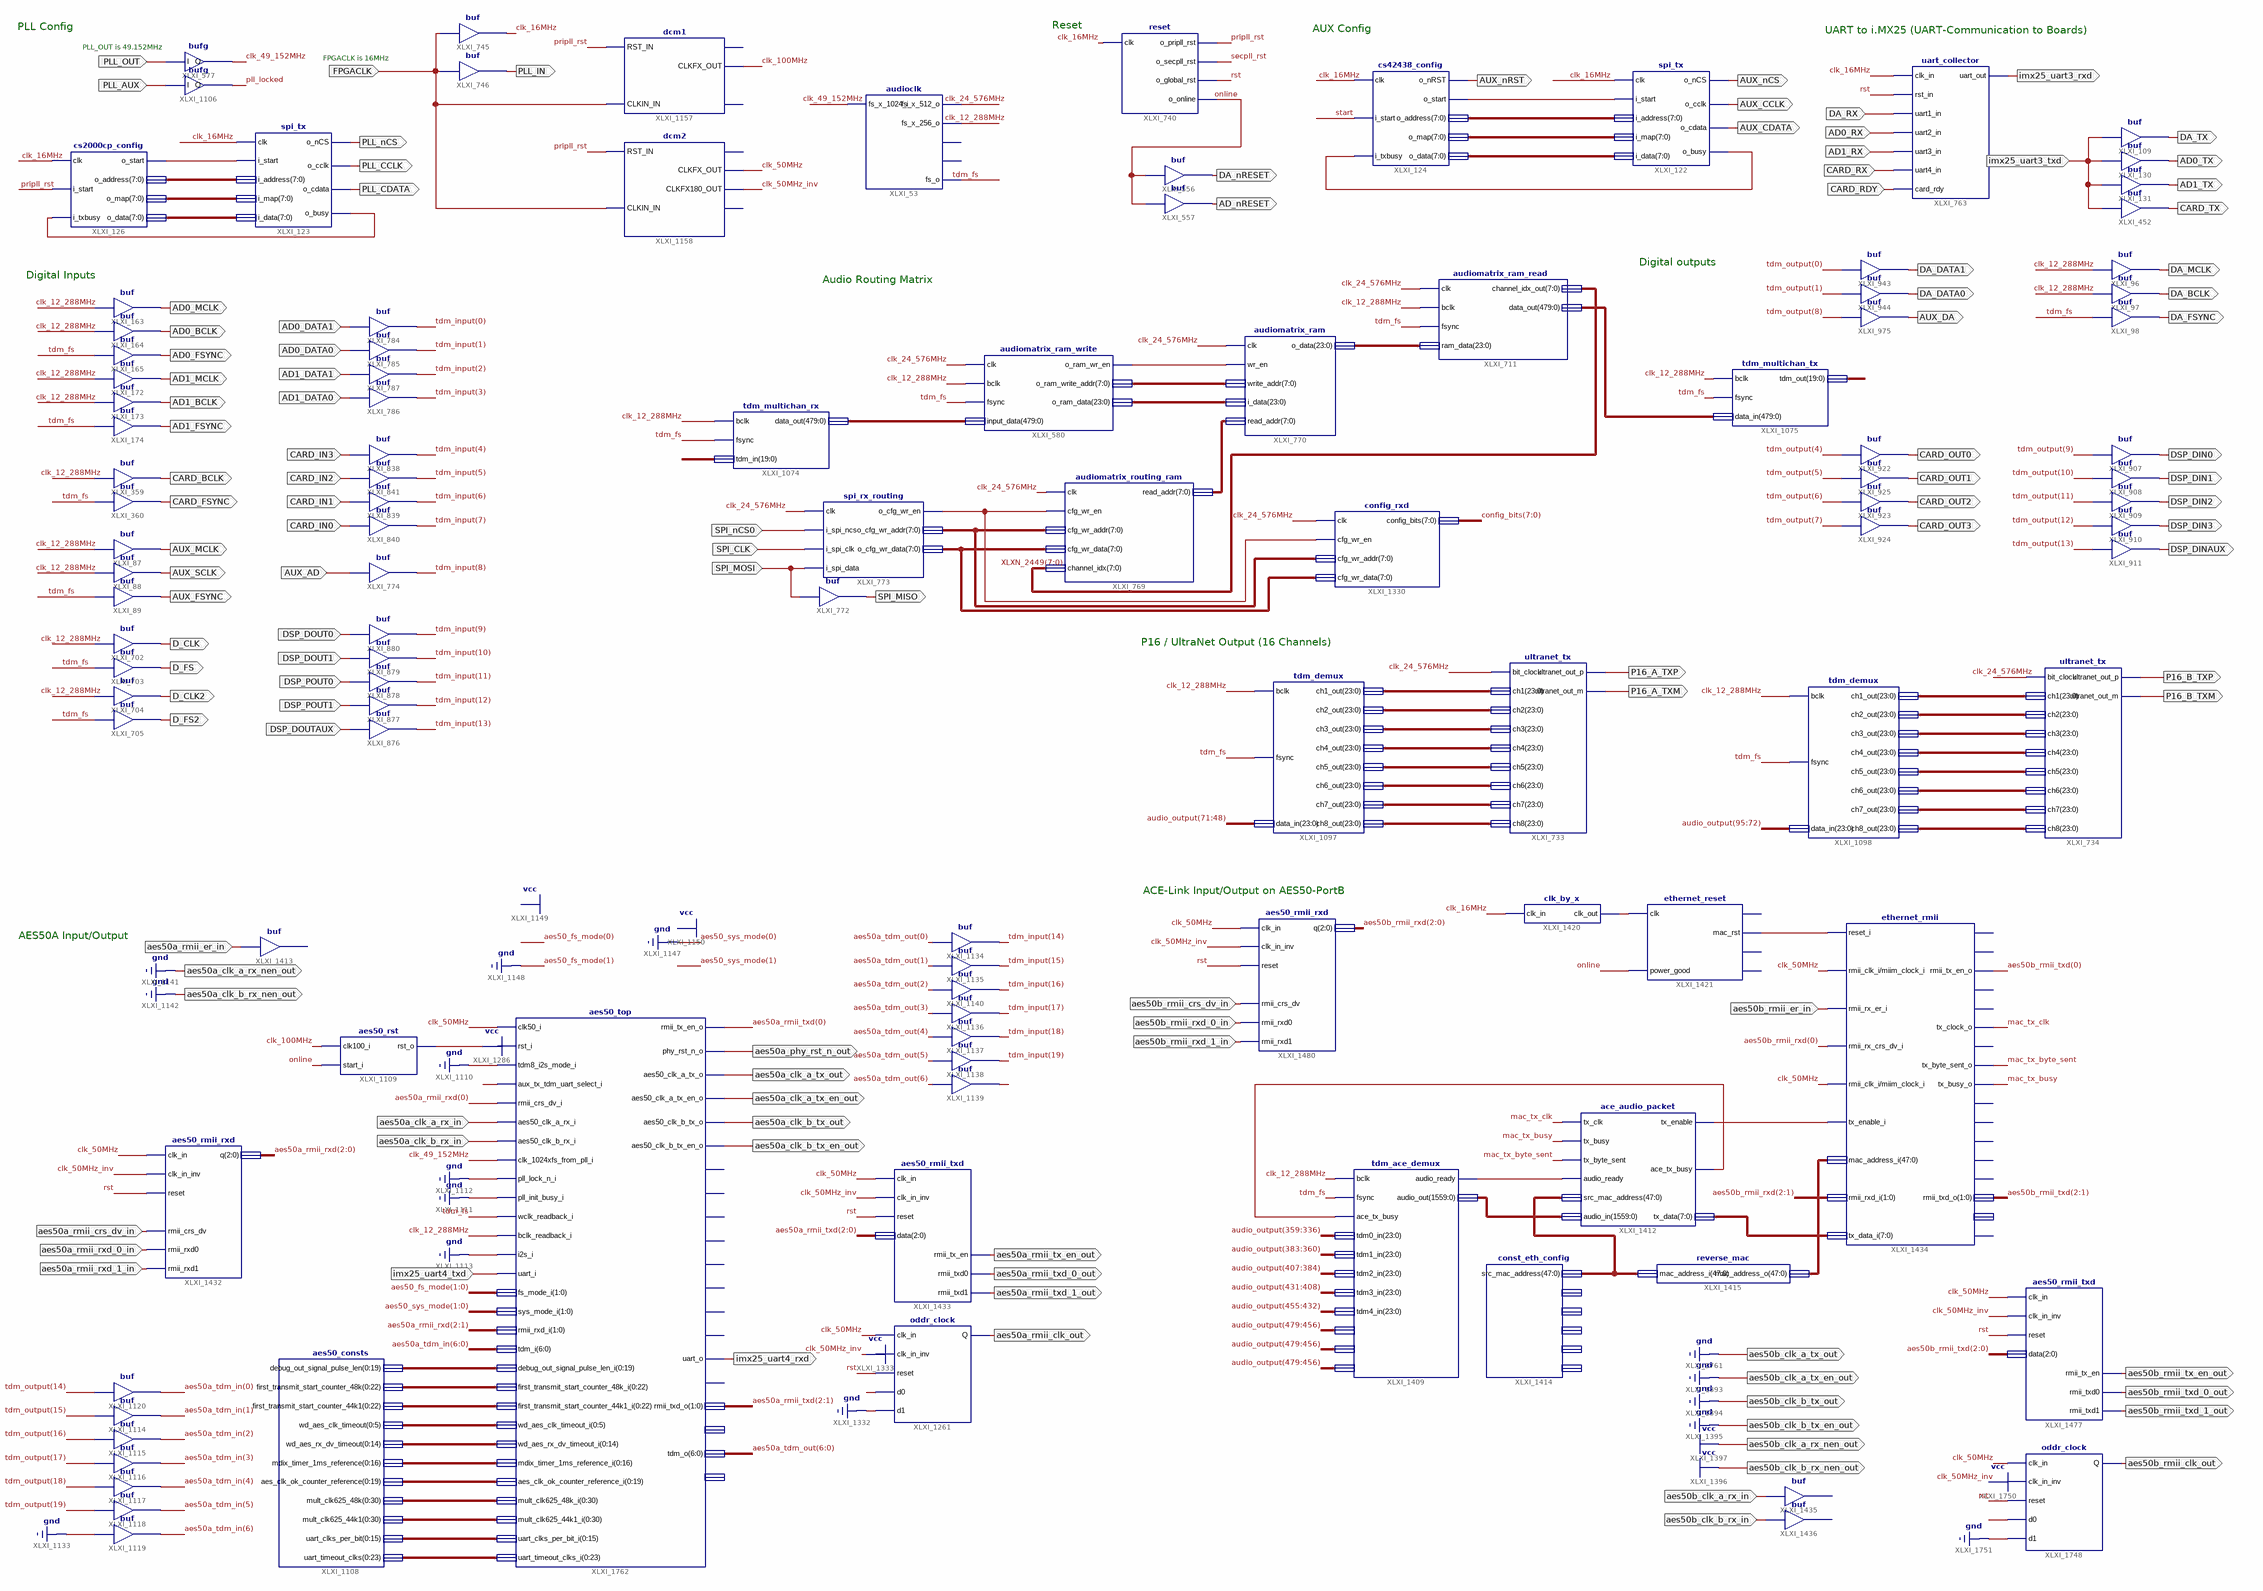
[diagram p0: schematic sheet 1]
// Xilinx ISE schematic main_aes50_and_ace.sch (spartan3a) as structural Verilog: 109 symbols, 111 ports
module main_aes50_and_ace (
  input  FPGACLK,
  input  PLL_OUT,
  input  PLL_AUX,
  input  aes50a_clk_a_rx_in,
  input  aes50a_clk_b_rx_in,
  input  imx25_uart4_txd,
  input  aes50a_rmii_er_in,
  input  aes50a_rmii_crs_dv_in,
  input  aes50a_rmii_rxd_0_in,
  input  aes50a_rmii_rxd_1_in,
  input  SPI_MOSI,
  input  SPI_CLK,
  input  SPI_nCS0,
  input  imx25_uart3_txd,
  input  CARD_RX,
  input  AD1_RX,
  input  AD0_RX,
  input  DA_RX,
  input  CARD_RDY,
  input  AD0_DATA1,
  input  AD0_DATA0,
  input  AD1_DATA1,
  input  AD1_DATA0,
  input  CARD_IN3,
  input  CARD_IN2,
  input  CARD_IN1,
  input  CARD_IN0,
  input  AUX_AD,
  input  DSP_DOUT0,
  input  DSP_DOUT1,
  input  DSP_POUT0,
  input  DSP_POUT1,
  input  DSP_DOUTAUX,
  input  aes50b_rmii_er_in,
  input  aes50b_rmii_crs_dv_in,
  input  aes50b_rmii_rxd_0_in,
  input  aes50b_rmii_rxd_1_in,
  input  aes50b_clk_a_rx_in,
  input  aes50b_clk_b_rx_in,
  output PLL_nCS,
  output PLL_CDATA,
  output PLL_CCLK,
  output PLL_IN,
  output aes50a_clk_b_rx_nen_out,
  output aes50a_clk_a_rx_nen_out,
  output aes50a_rmii_tx_en_out,
  output aes50a_rmii_txd_0_out,
  output aes50a_rmii_txd_1_out,
  output aes50a_rmii_clk_out,
  output SPI_MISO,
  output DSP_DIN0,
  output DSP_DIN1,
  output DSP_DIN2,
  output DSP_DIN3,
  output DSP_DINAUX,
  output CARD_OUT0,
  output CARD_OUT1,
  output CARD_OUT2,
  output CARD_OUT3,
  output DA_MCLK,
  output DA_BCLK,
  output DA_FSYNC,
  output DA_DATA0,
  output DA_DATA1,
  output AUX_DA,
  output P16_A_TXP,
  output P16_A_TXM,
  output P16_B_TXP,
  output P16_B_TXM,
  output DA_TX,
  output AD0_TX,
  output AD1_TX,
  output CARD_TX,
  output imx25_uart3_rxd,
  output AUX_nRST,
  output AUX_nCS,
  output AUX_CCLK,
  output AUX_CDATA,
  output AD_nRESET,
  output DA_nRESET,
  output AD1_MCLK,
  output AD1_BCLK,
  output AD1_FSYNC,
  output AD0_MCLK,
  output AD0_BCLK,
  output AD0_FSYNC,
  output CARD_BCLK,
  output CARD_FSYNC,
  output AUX_MCLK,
  output AUX_SCLK,
  output AUX_FSYNC,
  output D_CLK2,
  output D_FS2,
  output D_CLK,
  output D_FS,
  output aes50b_rmii_clk_out,
  output aes50b_rmii_tx_en_out,
  output aes50b_rmii_txd_0_out,
  output aes50b_rmii_txd_1_out,
  output aes50b_clk_b_rx_nen_out,
  output aes50b_clk_a_rx_nen_out,
  output aes50b_clk_b_tx_en_out,
  output aes50b_clk_b_tx_out,
  output aes50b_clk_a_tx_en_out,
  output aes50b_clk_a_tx_out,
  output imx25_uart4_rxd,
  output aes50a_phy_rst_n_out,
  output aes50a_clk_a_tx_out,
  output aes50a_clk_a_tx_en_out,
  output aes50a_clk_b_tx_out,
  output aes50a_clk_b_tx_en_out
);

  wire clk_12_288MHz, clk_16MHz, clk_24_576MHz, clk_49_152MHz, clk_50MHz, clk_50MHz_inv, clk_100MHz,
       mac_tx_busy, mac_tx_byte_sent, mac_tx_clk, online, pll_locked, pripll_rst, rst, secpll_rst, start,
       tdm_fs, XLXN_70, XLXN_222, XLXN_226, XLXN_346, XLXN_1898, XLXN_2460, XLXN_3074, XLXN_3123, XLXN_3858,
       XLXN_3874, XLXN_3892, XLXN_3930, XLXN_3936;
  wire [2:0] aes50a_rmii_rxd, aes50a_rmii_txd, aes50b_rmii_rxd, aes50b_rmii_txd;
  wire [5:0] XLXN_4220;
  wire [6:0] aes50a_tdm_in, aes50a_tdm_out;
  wire [7:0] config_bits, XLXN_67, XLXN_68, XLXN_69, XLXN_223, XLXN_224, XLXN_225, XLXN_2448, XLXN_2449,
       XLXN_2997, XLXN_3661, XLXN_3662, XLXN_4092;
  wire [14:0] XLXN_4221;
  wire [15:0] XLXN_4226;
  wire [16:0] XLXN_4222;
  wire [19:0] tdm_input, tdm_output, XLXN_4217, XLXN_4223;
  wire [22:0] XLXN_4218, XLXN_4219;
  wire [23:0] XLXN_2996, XLXN_2998, XLXN_3049, XLXN_3050, XLXN_3051, XLXN_3052, XLXN_3053, XLXN_3054,
       XLXN_3055, XLXN_3056, XLXN_3057, XLXN_3058, XLXN_3059, XLXN_3060, XLXN_3061, XLXN_3062, XLXN_3063,
       XLXN_3064, XLXN_4227;
  wire [30:0] XLXN_4224, XLXN_4225;
  wire [47:0] XLXN_3937, XLXN_3939;
  wire [479:0] audio_output, XLXN_2995;
  wire [1559:0] XLXN_3863;

  cs2000cp_config XLXI_126 (
    .clk(clk_16MHz), .i_start(pripll_rst), .i_txbusy(XLXN_226), .o_start(XLXN_222), .o_address(XLXN_223),
    .o_map(XLXN_224), .o_data(XLXN_225));
  spi_tx XLXI_123 (
    .clk(clk_16MHz), .i_start(XLXN_222), .i_address(XLXN_223), .i_map(XLXN_224), .i_data(XLXN_225),
    .o_nCS(PLL_nCS), .o_cclk(PLL_CCLK), .o_cdata(PLL_CDATA), .o_busy(XLXN_226));
  bufg XLXI_577 (.I(PLL_OUT), .O(clk_49_152MHz));
  bufg XLXI_1106 (.I(PLL_AUX), .O(pll_locked));
  buf XLXI_745 (clk_16MHz, FPGACLK);
  buf XLXI_746 (PLL_IN, FPGACLK);
  dcm1 XLXI_1157 (.CLKIN_IN(FPGACLK), .RST_IN(pripll_rst), .CLKFX_OUT(clk_100MHz));  // open: LOCKED_OUT, CLK0_OUT
  dcm2 XLXI_1158 (
    .CLKIN_IN(FPGACLK), .RST_IN(pripll_rst), .CLKFX_OUT(clk_50MHz), .CLKFX180_OUT(clk_50MHz_inv));  // open: LOCKED_OUT, CLK0_OUT
  aes50_rst XLXI_1109 (.clk100_i(clk_100MHz), .start_i(online), .rst_o(XLXN_3074));
  aes50_consts XLXI_1108 (
    .debug_out_signal_pulse_len({XLXN_4217[0], XLXN_4217[1], XLXN_4217[2], XLXN_4217[3], XLXN_4217[4], XLXN_4217[5], XLXN_4217[6], XLXN_4217[7], XLXN_4217[8], XLXN_4217[9], XLXN_4217[10], XLXN_4217[11], XLXN_4217[12], XLXN_4217[13], XLXN_4217[14], XLXN_4217[15], XLXN_4217[16], XLXN_4217[17], XLXN_4217[18], XLXN_4217[19]}),
    .first_transmit_start_counter_48k({XLXN_4218[0], XLXN_4218[1], XLXN_4218[2], XLXN_4218[3], XLXN_4218[4], XLXN_4218[5], XLXN_4218[6], XLXN_4218[7], XLXN_4218[8], XLXN_4218[9], XLXN_4218[10], XLXN_4218[11], XLXN_4218[12], XLXN_4218[13], XLXN_4218[14], XLXN_4218[15], XLXN_4218[16], XLXN_4218[17], XLXN_4218[18], XLXN_4218[19], XLXN_4218[20], XLXN_4218[21], XLXN_4218[22]}),
    .first_transmit_start_counter_44k1({XLXN_4219[0], XLXN_4219[1], XLXN_4219[2], XLXN_4219[3], XLXN_4219[4], XLXN_4219[5], XLXN_4219[6], XLXN_4219[7], XLXN_4219[8], XLXN_4219[9], XLXN_4219[10], XLXN_4219[11], XLXN_4219[12], XLXN_4219[13], XLXN_4219[14], XLXN_4219[15], XLXN_4219[16], XLXN_4219[17], XLXN_4219[18], XLXN_4219[19], XLXN_4219[20], XLXN_4219[21], XLXN_4219[22]}),
    .wd_aes_clk_timeout({XLXN_4220[0], XLXN_4220[1], XLXN_4220[2], XLXN_4220[3], XLXN_4220[4], XLXN_4220[5]}),
    .wd_aes_rx_dv_timeout({XLXN_4221[0], XLXN_4221[1], XLXN_4221[2], XLXN_4221[3], XLXN_4221[4], XLXN_4221[5], XLXN_4221[6], XLXN_4221[7], XLXN_4221[8], XLXN_4221[9], XLXN_4221[10], XLXN_4221[11], XLXN_4221[12], XLXN_4221[13], XLXN_4221[14]}),
    .mdix_timer_1ms_reference({XLXN_4222[0], XLXN_4222[1], XLXN_4222[2], XLXN_4222[3], XLXN_4222[4], XLXN_4222[5], XLXN_4222[6], XLXN_4222[7], XLXN_4222[8], XLXN_4222[9], XLXN_4222[10], XLXN_4222[11], XLXN_4222[12], XLXN_4222[13], XLXN_4222[14], XLXN_4222[15], XLXN_4222[16]}),
    .aes_clk_ok_counter_reference({XLXN_4223[0], XLXN_4223[1], XLXN_4223[2], XLXN_4223[3], XLXN_4223[4], XLXN_4223[5], XLXN_4223[6], XLXN_4223[7], XLXN_4223[8], XLXN_4223[9], XLXN_4223[10], XLXN_4223[11], XLXN_4223[12], XLXN_4223[13], XLXN_4223[14], XLXN_4223[15], XLXN_4223[16], XLXN_4223[17], XLXN_4223[18], XLXN_4223[19]}),
    .mult_clk625_48k({XLXN_4224[0], XLXN_4224[1], XLXN_4224[2], XLXN_4224[3], XLXN_4224[4], XLXN_4224[5], XLXN_4224[6], XLXN_4224[7], XLXN_4224[8], XLXN_4224[9], XLXN_4224[10], XLXN_4224[11], XLXN_4224[12], XLXN_4224[13], XLXN_4224[14], XLXN_4224[15], XLXN_4224[16], XLXN_4224[17], XLXN_4224[18], XLXN_4224[19], XLXN_4224[20], XLXN_4224[21], XLXN_4224[22], XLXN_4224[23], XLXN_4224[24], XLXN_4224[25], XLXN_4224[26], XLXN_4224[27], XLXN_4224[28], XLXN_4224[29], XLXN_4224[30]}),
    .mult_clk625_44k1({XLXN_4225[0], XLXN_4225[1], XLXN_4225[2], XLXN_4225[3], XLXN_4225[4], XLXN_4225[5], XLXN_4225[6], XLXN_4225[7], XLXN_4225[8], XLXN_4225[9], XLXN_4225[10], XLXN_4225[11], XLXN_4225[12], XLXN_4225[13], XLXN_4225[14], XLXN_4225[15], XLXN_4225[16], XLXN_4225[17], XLXN_4225[18], XLXN_4225[19], XLXN_4225[20], XLXN_4225[21], XLXN_4225[22], XLXN_4225[23], XLXN_4225[24], XLXN_4225[25], XLXN_4225[26], XLXN_4225[27], XLXN_4225[28], XLXN_4225[29], XLXN_4225[30]}),
    .uart_clks_per_bit({XLXN_4226[0], XLXN_4226[1], XLXN_4226[2], XLXN_4226[3], XLXN_4226[4], XLXN_4226[5], XLXN_4226[6], XLXN_4226[7], XLXN_4226[8], XLXN_4226[9], XLXN_4226[10], XLXN_4226[11], XLXN_4226[12], XLXN_4226[13], XLXN_4226[14], XLXN_4226[15]}),
    .uart_timeout_clks({XLXN_4227[0], XLXN_4227[1], XLXN_4227[2], XLXN_4227[3], XLXN_4227[4], XLXN_4227[5], XLXN_4227[6], XLXN_4227[7], XLXN_4227[8], XLXN_4227[9], XLXN_4227[10], XLXN_4227[11], XLXN_4227[12], XLXN_4227[13], XLXN_4227[14], XLXN_4227[15], XLXN_4227[16], XLXN_4227[17], XLXN_4227[18], XLXN_4227[19], XLXN_4227[20], XLXN_4227[21], XLXN_4227[22], XLXN_4227[23]}));
  buf XLXI_1120 (aes50a_tdm_in[0], tdm_output[14]);
  buf XLXI_1114 (aes50a_tdm_in[1], tdm_output[15]);
  buf XLXI_1115 (aes50a_tdm_in[2], tdm_output[16]);
  buf XLXI_1116 (aes50a_tdm_in[3], tdm_output[17]);
  buf XLXI_1117 (aes50a_tdm_in[4], tdm_output[18]);
  buf XLXI_1118 (aes50a_tdm_in[5], tdm_output[19]);
  buf XLXI_1119 (aes50a_tdm_in[6], 1'b0);
  // buf XLXI_1413 has open pins: I=aes50a_rmii_er_in, O=open
  aes50_rmii_rxd XLXI_1432 (
    .clk_in(clk_50MHz), .clk_in_inv(clk_50MHz_inv), .reset(rst), .q(aes50a_rmii_rxd),
    .rmii_crs_dv(aes50a_rmii_crs_dv_in), .rmii_rxd0(aes50a_rmii_rxd_0_in), .rmii_rxd1(aes50a_rmii_rxd_1_in));
  oddr_clock XLXI_1261 (
    .clk_in(clk_50MHz), .clk_in_inv(clk_50MHz_inv), .reset(rst), .d0(1'b1), .d1(1'b0), .Q(aes50a_rmii_clk_out));
  aes50_rmii_txd XLXI_1433 (
    .clk_in(clk_50MHz), .clk_in_inv(clk_50MHz_inv), .reset(rst), .data(aes50a_rmii_txd),
    .rmii_tx_en(aes50a_rmii_tx_en_out), .rmii_txd0(aes50a_rmii_txd_0_out), .rmii_txd1(aes50a_rmii_txd_1_out));
  buf XLXI_1134 (tdm_input[14], aes50a_tdm_out[0]);
  buf XLXI_1135 (tdm_input[15], aes50a_tdm_out[1]);
  buf XLXI_1136 (tdm_input[17], aes50a_tdm_out[3]);
  buf XLXI_1137 (tdm_input[18], aes50a_tdm_out[4]);
  buf XLXI_1138 (tdm_input[19], aes50a_tdm_out[5]);
  buf XLXI_1139 (XLXN_3123, aes50a_tdm_out[6]);
  buf XLXI_1140 (tdm_input[16], aes50a_tdm_out[2]);
  audiomatrix_ram_write XLXI_580 (
    .clk(clk_24_576MHz), .o_ram_wr_en(XLXN_1898), .o_ram_write_addr(XLXN_2997), .o_ram_data(XLXN_2996),
    .bclk(clk_12_288MHz), .fsync(tdm_fs), .input_data(XLXN_2995));
  audiomatrix_routing_ram XLXI_769 (
    .clk(clk_24_576MHz), .cfg_wr_en(XLXN_2460), .cfg_wr_addr(XLXN_3661), .cfg_wr_data(XLXN_3662),
    .read_addr(XLXN_2448), .channel_idx(XLXN_2449));
  audiomatrix_ram XLXI_770 (
    .clk(clk_24_576MHz), .wr_en(XLXN_1898), .o_data(XLXN_2998), .write_addr(XLXN_2997), .i_data(XLXN_2996),
    .read_addr(XLXN_2448));
  audiomatrix_ram_read XLXI_711 (
    .clk(clk_24_576MHz), .bclk(clk_12_288MHz), .fsync(tdm_fs), .ram_data(XLXN_2998),
    .channel_idx_out(XLXN_2449), .data_out(audio_output));
  tdm_multichan_rx XLXI_1074 (.bclk(clk_12_288MHz), .fsync(tdm_fs), .tdm_in(tdm_input), .data_out(XLXN_2995));
  tdm_multichan_tx XLXI_1075 (.bclk(clk_12_288MHz), .fsync(tdm_fs), .data_in(audio_output), .tdm_out(tdm_output));
  buf XLXI_772 (SPI_MISO, SPI_MOSI);
  spi_rx_routing XLXI_773 (
    .clk(clk_24_576MHz), .i_spi_ncs(SPI_nCS0), .i_spi_clk(SPI_CLK), .i_spi_data(SPI_MOSI),
    .o_cfg_wr_en(XLXN_2460), .o_cfg_wr_addr(XLXN_3661), .o_cfg_wr_data(XLXN_3662));
  buf XLXI_907 (DSP_DIN0, tdm_output[9]);
  buf XLXI_908 (DSP_DIN1, tdm_output[10]);
  buf XLXI_909 (DSP_DIN2, tdm_output[11]);
  buf XLXI_910 (DSP_DIN3, tdm_output[12]);
  buf XLXI_911 (DSP_DINAUX, tdm_output[13]);
  buf XLXI_922 (CARD_OUT0, tdm_output[4]);
  buf XLXI_925 (CARD_OUT1, tdm_output[5]);
  buf XLXI_923 (CARD_OUT2, tdm_output[6]);
  buf XLXI_924 (CARD_OUT3, tdm_output[7]);
  buf XLXI_96 (DA_MCLK, clk_12_288MHz);
  buf XLXI_97 (DA_BCLK, clk_12_288MHz);
  buf XLXI_98 (DA_FSYNC, tdm_fs);
  buf XLXI_944 (DA_DATA0, tdm_output[1]);
  buf XLXI_943 (DA_DATA1, tdm_output[0]);
  buf XLXI_975 (AUX_DA, tdm_output[8]);
  config_rxd XLXI_1330 (
    .clk(clk_24_576MHz), .cfg_wr_en(XLXN_2460), .cfg_wr_addr(XLXN_3661), .cfg_wr_data(XLXN_3662),
    .config_bits(config_bits));
  tdm_demux XLXI_1097 (
    .bclk(clk_12_288MHz), .fsync(tdm_fs), .data_in(audio_output[71:48]), .ch1_out(XLXN_3049),
    .ch2_out(XLXN_3050), .ch3_out(XLXN_3051), .ch4_out(XLXN_3052), .ch5_out(XLXN_3053), .ch6_out(XLXN_3054),
    .ch7_out(XLXN_3055), .ch8_out(XLXN_3056));
  ultranet_tx XLXI_733 (
    .bit_clock(clk_24_576MHz), .ch1(XLXN_3049), .ch2(XLXN_3050), .ch3(XLXN_3051), .ch4(XLXN_3052),
    .ch5(XLXN_3053), .ch6(XLXN_3054), .ch7(XLXN_3055), .ch8(XLXN_3056), .ultranet_out_p(P16_A_TXP),
    .ultranet_out_m(P16_A_TXM));
  ultranet_tx XLXI_734 (
    .bit_clock(clk_24_576MHz), .ch1(XLXN_3057), .ch2(XLXN_3058), .ch3(XLXN_3059), .ch4(XLXN_3060),
    .ch5(XLXN_3061), .ch6(XLXN_3062), .ch7(XLXN_3063), .ch8(XLXN_3064), .ultranet_out_p(P16_B_TXP),
    .ultranet_out_m(P16_B_TXM));
  tdm_demux XLXI_1098 (
    .bclk(clk_12_288MHz), .fsync(tdm_fs), .data_in(audio_output[95:72]), .ch1_out(XLXN_3057),
    .ch2_out(XLXN_3058), .ch3_out(XLXN_3059), .ch4_out(XLXN_3060), .ch5_out(XLXN_3061), .ch6_out(XLXN_3062),
    .ch7_out(XLXN_3063), .ch8_out(XLXN_3064));
  buf XLXI_130 (AD0_TX, imx25_uart3_txd);
  buf XLXI_131 (AD1_TX, imx25_uart3_txd);
  buf XLXI_109 (DA_TX, imx25_uart3_txd);
  buf XLXI_452 (CARD_TX, imx25_uart3_txd);
  uart_collector XLXI_763 (
    .clk_in(clk_16MHz), .rst_in(rst), .uart1_in(DA_RX), .uart2_in(AD0_RX), .uart3_in(AD1_RX),
    .uart4_in(CARD_RX), .card_rdy(CARD_RDY), .uart_out(imx25_uart3_rxd));
  spi_tx XLXI_122 (
    .clk(clk_16MHz), .i_start(XLXN_346), .i_address(XLXN_67), .i_map(XLXN_68), .i_data(XLXN_69),
    .o_nCS(AUX_nCS), .o_cclk(AUX_CCLK), .o_cdata(AUX_CDATA), .o_busy(XLXN_70));
  cs42438_config XLXI_124 (
    .clk(clk_16MHz), .i_start(start), .i_txbusy(XLXN_70), .o_nRST(AUX_nRST), .o_start(XLXN_346),
    .o_address(XLXN_67), .o_map(XLXN_68), .o_data(XLXN_69));
  buf XLXI_556 (DA_nRESET, online);
  buf XLXI_557 (AD_nRESET, online);
  reset XLXI_740 (
    .clk(clk_16MHz), .o_pripll_rst(pripll_rst), .o_secpll_rst(secpll_rst), .o_global_rst(rst),
    .o_online(online));
  audioclk XLXI_53 (
    .fs_x_1024_i(clk_49_152MHz), .fs_x_512_o(clk_24_576MHz), .fs_x_256_o(clk_12_288MHz), .fs_o(tdm_fs));  // open: fs_x_128_o, fs_x_64_o
  buf XLXI_172 (AD1_MCLK, clk_12_288MHz);
  buf XLXI_173 (AD1_BCLK, clk_12_288MHz);
  buf XLXI_174 (AD1_FSYNC, tdm_fs);
  buf XLXI_163 (AD0_MCLK, clk_12_288MHz);
  buf XLXI_164 (AD0_BCLK, clk_12_288MHz);
  buf XLXI_165 (AD0_FSYNC, tdm_fs);
  buf XLXI_784 (tdm_input[0], AD0_DATA1);
  buf XLXI_785 (tdm_input[1], AD0_DATA0);
  buf XLXI_787 (tdm_input[2], AD1_DATA1);
  buf XLXI_786 (tdm_input[3], AD1_DATA0);
  buf XLXI_838 (tdm_input[4], CARD_IN3);
  buf XLXI_841 (tdm_input[5], CARD_IN2);
  buf XLXI_839 (tdm_input[6], CARD_IN1);
  buf XLXI_840 (tdm_input[7], CARD_IN0);
  buf XLXI_359 (CARD_BCLK, clk_12_288MHz);
  buf XLXI_360 (CARD_FSYNC, tdm_fs);
  buf XLXI_87 (AUX_MCLK, clk_12_288MHz);
  buf XLXI_88 (AUX_SCLK, clk_12_288MHz);
  buf XLXI_89 (AUX_FSYNC, tdm_fs);
  buf XLXI_774 (tdm_input[8], AUX_AD);
  buf XLXI_880 (tdm_input[9], DSP_DOUT0);
  buf XLXI_879 (tdm_input[10], DSP_DOUT1);
  buf XLXI_878 (tdm_input[11], DSP_POUT0);
  buf XLXI_877 (tdm_input[12], DSP_POUT1);
  buf XLXI_876 (tdm_input[13], DSP_DOUTAUX);
  buf XLXI_704 (D_CLK2, clk_12_288MHz);
  buf XLXI_705 (D_FS2, tdm_fs);
  buf XLXI_702 (D_CLK, clk_12_288MHz);
  buf XLXI_703 (D_FS, tdm_fs);
  ethernet_rmii XLXI_1434 (
    .reset_i(XLXN_3930), .rmii_clk_i(clk_50MHz), .rmii_rx_er_i(aes50b_rmii_er_in),
    .rmii_rx_crs_dv_i(aes50b_rmii_rxd[0]), .miim_clock_i(clk_50MHz), .tx_enable_i(XLXN_3936),
    .mac_address_i(XLXN_3937), .rmii_rxd_i(aes50b_rmii_rxd[2:1]), .tx_data_i(XLXN_4092),
    .rmii_tx_en_o(aes50b_rmii_txd[0]), .tx_clock_o(mac_tx_clk), .tx_byte_sent_o(mac_tx_byte_sent),
    .tx_busy_o(mac_tx_busy), .rmii_txd_o(aes50b_rmii_txd[2:1]));  // open: mdio_io, reset_o, rmii_tx_er_o, mdc_o, link_up_o, tx_reset_o, rx_clock_o, rx_reset_o, rx_frame_o, rx_byte_received_o, rx_error_o, rx_data_o
  tdm_ace_demux XLXI_1409 (
    .bclk(clk_12_288MHz), .fsync(tdm_fs), .ace_tx_busy(XLXN_3892), .tdm0_in(audio_output[359:336]),
    .tdm1_in(audio_output[383:360]), .tdm2_in(audio_output[407:384]), .tdm3_in(audio_output[431:408]),
    .tdm4_in(audio_output[455:432]), .tdm5_in(audio_output[479:456]), .tdm6_in(audio_output[479:456]),
    .tdm7_in(audio_output[479:456]), .audio_ready(XLXN_3858), .audio_out(XLXN_3863));
  ace_audio_packet XLXI_1412 (
    .tx_clk(mac_tx_clk), .tx_busy(mac_tx_busy), .tx_byte_sent(mac_tx_byte_sent), .audio_ready(XLXN_3858),
    .src_mac_address(XLXN_3939), .audio_in(XLXN_3863), .tx_enable(XLXN_3936), .ace_tx_busy(XLXN_3892),
    .tx_data(XLXN_4092));
  const_eth_config XLXI_1414 (.src_mac_address(XLXN_3939));  // open: src_ip_address, dst_mac_address, dst_ip_address, src_udp_port, dst_udp_port
  reverse_mac XLXI_1415 (.mac_address_i(XLXN_3939), .mac_address_o(XLXN_3937));
  ethernet_reset XLXI_1421 (
    .clk(XLXN_3874), .power_good(online), .mac_rst(XLXN_3930));  // open: phy_rstn, sendArpRequest, tx_online
  clk_by_x XLXI_1420 (.clk_in(clk_16MHz), .clk_out(XLXN_3874));
  aes50_rmii_rxd XLXI_1480 (
    .clk_in(clk_50MHz), .clk_in_inv(clk_50MHz_inv), .reset(rst), .q(aes50b_rmii_rxd),
    .rmii_crs_dv(aes50b_rmii_crs_dv_in), .rmii_rxd0(aes50b_rmii_rxd_0_in), .rmii_rxd1(aes50b_rmii_rxd_1_in));
  oddr_clock XLXI_1748 (
    .clk_in(clk_50MHz), .clk_in_inv(clk_50MHz_inv), .reset(rst), .d0(1'b1), .d1(1'b0), .Q(aes50b_rmii_clk_out));
  aes50_rmii_txd XLXI_1477 (
    .clk_in(clk_50MHz), .clk_in_inv(clk_50MHz_inv), .reset(rst), .data(aes50b_rmii_txd),
    .rmii_tx_en(aes50b_rmii_tx_en_out), .rmii_txd0(aes50b_rmii_txd_0_out), .rmii_txd1(aes50b_rmii_txd_1_out));
  // buf XLXI_1435 has open pins: I=aes50b_clk_a_rx_in, O=open
  // buf XLXI_1436 has open pins: I=aes50b_clk_b_rx_in, O=open
  aes50_top XLXI_1762 (
    .clk50_i(clk_50MHz), .rst_i(XLXN_3074), .tdm8_i2s_mode_i(1'b0), .aux_tx_tdm_uart_select_i(1'b1),
    .rmii_crs_dv_i(aes50a_rmii_rxd[0]), .aes50_clk_a_rx_i(aes50a_clk_a_rx_in),
    .aes50_clk_b_rx_i(aes50a_clk_b_rx_in), .clk_1024xfs_from_pll_i(clk_49_152MHz), .pll_lock_n_i(1'b0),
    .pll_init_busy_i(1'b0), .wclk_readback_i(tdm_fs), .bclk_readback_i(clk_12_288MHz), .i2s_i(1'b0),
    .uart_i(imx25_uart4_txd), .fs_mode_i(2'b01), .sys_mode_i(2'b10), .rmii_rxd_i(aes50a_rmii_rxd[2:1]),
    .tdm_i(aes50a_tdm_in),
    .debug_out_signal_pulse_len_i({XLXN_4217[0], XLXN_4217[1], XLXN_4217[2], XLXN_4217[3], XLXN_4217[4], XLXN_4217[5], XLXN_4217[6], XLXN_4217[7], XLXN_4217[8], XLXN_4217[9], XLXN_4217[10], XLXN_4217[11], XLXN_4217[12], XLXN_4217[13], XLXN_4217[14], XLXN_4217[15], XLXN_4217[16], XLXN_4217[17], XLXN_4217[18], XLXN_4217[19]}),
    .first_transmit_start_counter_48k_i({XLXN_4218[0], XLXN_4218[1], XLXN_4218[2], XLXN_4218[3], XLXN_4218[4], XLXN_4218[5], XLXN_4218[6], XLXN_4218[7], XLXN_4218[8], XLXN_4218[9], XLXN_4218[10], XLXN_4218[11], XLXN_4218[12], XLXN_4218[13], XLXN_4218[14], XLXN_4218[15], XLXN_4218[16], XLXN_4218[17], XLXN_4218[18], XLXN_4218[19], XLXN_4218[20], XLXN_4218[21], XLXN_4218[22]}),
    .first_transmit_start_counter_44k1_i({XLXN_4219[0], XLXN_4219[1], XLXN_4219[2], XLXN_4219[3], XLXN_4219[4], XLXN_4219[5], XLXN_4219[6], XLXN_4219[7], XLXN_4219[8], XLXN_4219[9], XLXN_4219[10], XLXN_4219[11], XLXN_4219[12], XLXN_4219[13], XLXN_4219[14], XLXN_4219[15], XLXN_4219[16], XLXN_4219[17], XLXN_4219[18], XLXN_4219[19], XLXN_4219[20], XLXN_4219[21], XLXN_4219[22]}),
    .wd_aes_clk_timeout_i({XLXN_4220[0], XLXN_4220[1], XLXN_4220[2], XLXN_4220[3], XLXN_4220[4], XLXN_4220[5]}),
    .wd_aes_rx_dv_timeout_i({XLXN_4221[0], XLXN_4221[1], XLXN_4221[2], XLXN_4221[3], XLXN_4221[4], XLXN_4221[5], XLXN_4221[6], XLXN_4221[7], XLXN_4221[8], XLXN_4221[9], XLXN_4221[10], XLXN_4221[11], XLXN_4221[12], XLXN_4221[13], XLXN_4221[14]}),
    .mdix_timer_1ms_reference_i({XLXN_4222[0], XLXN_4222[1], XLXN_4222[2], XLXN_4222[3], XLXN_4222[4], XLXN_4222[5], XLXN_4222[6], XLXN_4222[7], XLXN_4222[8], XLXN_4222[9], XLXN_4222[10], XLXN_4222[11], XLXN_4222[12], XLXN_4222[13], XLXN_4222[14], XLXN_4222[15], XLXN_4222[16]}),
    .aes_clk_ok_counter_reference_i({XLXN_4223[0], XLXN_4223[1], XLXN_4223[2], XLXN_4223[3], XLXN_4223[4], XLXN_4223[5], XLXN_4223[6], XLXN_4223[7], XLXN_4223[8], XLXN_4223[9], XLXN_4223[10], XLXN_4223[11], XLXN_4223[12], XLXN_4223[13], XLXN_4223[14], XLXN_4223[15], XLXN_4223[16], XLXN_4223[17], XLXN_4223[18], XLXN_4223[19]}),
    .mult_clk625_48k_i({XLXN_4224[0], XLXN_4224[1], XLXN_4224[2], XLXN_4224[3], XLXN_4224[4], XLXN_4224[5], XLXN_4224[6], XLXN_4224[7], XLXN_4224[8], XLXN_4224[9], XLXN_4224[10], XLXN_4224[11], XLXN_4224[12], XLXN_4224[13], XLXN_4224[14], XLXN_4224[15], XLXN_4224[16], XLXN_4224[17], XLXN_4224[18], XLXN_4224[19], XLXN_4224[20], XLXN_4224[21], XLXN_4224[22], XLXN_4224[23], XLXN_4224[24], XLXN_4224[25], XLXN_4224[26], XLXN_4224[27], XLXN_4224[28], XLXN_4224[29], XLXN_4224[30]}),
    .mult_clk625_44k1_i({XLXN_4225[0], XLXN_4225[1], XLXN_4225[2], XLXN_4225[3], XLXN_4225[4], XLXN_4225[5], XLXN_4225[6], XLXN_4225[7], XLXN_4225[8], XLXN_4225[9], XLXN_4225[10], XLXN_4225[11], XLXN_4225[12], XLXN_4225[13], XLXN_4225[14], XLXN_4225[15], XLXN_4225[16], XLXN_4225[17], XLXN_4225[18], XLXN_4225[19], XLXN_4225[20], XLXN_4225[21], XLXN_4225[22], XLXN_4225[23], XLXN_4225[24], XLXN_4225[25], XLXN_4225[26], XLXN_4225[27], XLXN_4225[28], XLXN_4225[29], XLXN_4225[30]}),
    .uart_clks_per_bit_i({XLXN_4226[0], XLXN_4226[1], XLXN_4226[2], XLXN_4226[3], XLXN_4226[4], XLXN_4226[5], XLXN_4226[6], XLXN_4226[7], XLXN_4226[8], XLXN_4226[9], XLXN_4226[10], XLXN_4226[11], XLXN_4226[12], XLXN_4226[13], XLXN_4226[14], XLXN_4226[15]}),
    .uart_timeout_clks_i({XLXN_4227[0], XLXN_4227[1], XLXN_4227[2], XLXN_4227[3], XLXN_4227[4], XLXN_4227[5], XLXN_4227[6], XLXN_4227[7], XLXN_4227[8], XLXN_4227[9], XLXN_4227[10], XLXN_4227[11], XLXN_4227[12], XLXN_4227[13], XLXN_4227[14], XLXN_4227[15], XLXN_4227[16], XLXN_4227[17], XLXN_4227[18], XLXN_4227[19], XLXN_4227[20], XLXN_4227[21], XLXN_4227[22], XLXN_4227[23]}),
    .rmii_tx_en_o(aes50a_rmii_txd[0]), .phy_rst_n_o(aes50a_phy_rst_n_out),
    .aes50_clk_a_tx_o(aes50a_clk_a_tx_out), .aes50_clk_a_tx_en_o(aes50a_clk_a_tx_en_out),
    .aes50_clk_b_tx_o(aes50a_clk_b_tx_out), .aes50_clk_b_tx_en_o(aes50a_clk_b_tx_en_out),
    .uart_o(imx25_uart4_rxd), .rmii_txd_o(aes50a_rmii_txd[2:1]), .tdm_o(aes50a_tdm_out));  // open: clk_to_pll_o, mclk_o, wclk_o, bclk_o, wclk_out_en_o, bclk_out_en_o, i2s_o, aes_ok_o, uart_overflow_o, pll_mult_value_o, dbg_o

  assign aes50a_clk_a_rx_nen_out = 1'b0;
  assign aes50a_clk_b_rx_nen_out = 1'b0;
  assign aes50b_clk_a_rx_nen_out = 1'b1;
  assign aes50b_clk_a_tx_en_out = 1'b0;
  assign aes50b_clk_a_tx_out = 1'b0;
  assign aes50b_clk_b_rx_nen_out = 1'b1;
  assign aes50b_clk_b_tx_en_out = 1'b0;
  assign aes50b_clk_b_tx_out = 1'b0;

  // Notes on the sheet:
  //   Reset
  //   PLL Config
  //   AUX Config
  //   UART to i.MX25 (UART-Communication to Boards)
  //   PLL_OUT is 49.152MHz
  //   FPGACLK is 16MHz
  //   Digital outputs
  //   Digital Inputs
  //   Audio Routing Matrix
  //   P16 / UltraNet Output (16 Channels)
  //   ACE-Link Input/Output on AES50-PortB
  //   AES50A Input/Output
endmodule
